# Altium project AVault.PrjPcb (part 1 of 2)
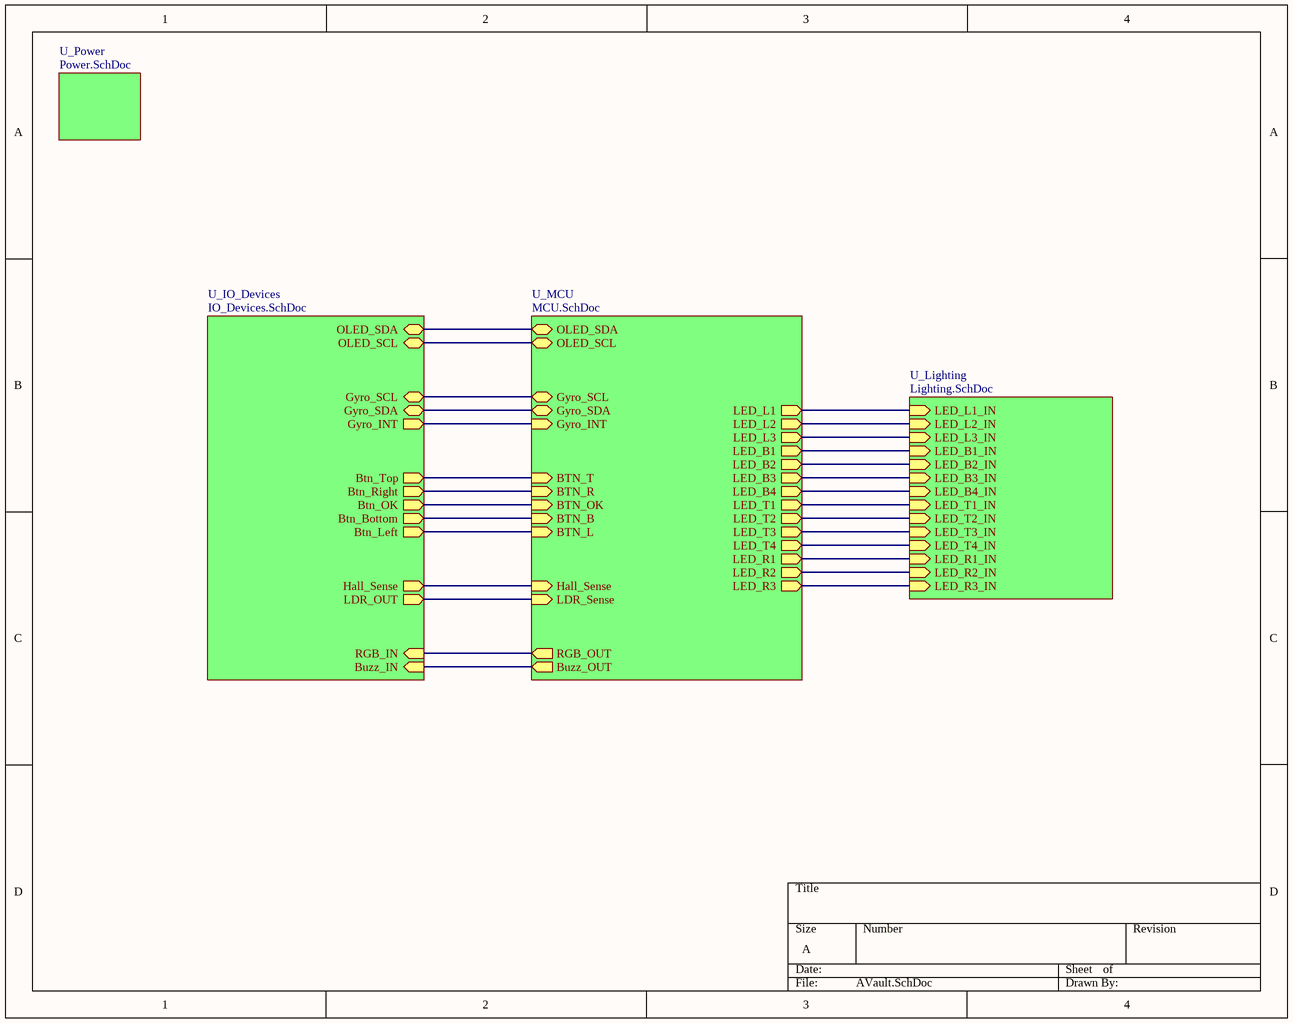
[diagram p0: AVault.SchDoc]
5 sheets, 122 parts. Net scope: hierarchical (ports join the sheet entries above them; power ports are global).
Board file: AVault.PcbDoc
Sheets:
  AVault.SchDoc
    U_Power = Power.SchDoc
    U_MCU = MCU.SchDoc
    U_IO_Devices = IO_Devices.SchDoc
    U_Lighting = Lighting.SchDoc

## Sheet AVault.SchDoc
size A; SheetNumber: 1; SheetTotal: 5

### Sub-sheets
U_IO_Devices = IO_Devices.SchDoc: OLED_SDA (bidir), OLED_SCL (bidir), Gyro_SCL (bidir), Gyro_SDA (bidir), Gyro_INT (out), Btn_Top (out), Btn_Right (out), Btn_OK (out), Btn_Bottom (out), Btn_Left (out), Hall_Sense (out), LDR_OUT (out), RGB_IN (in), Buzz_IN (in)
U_Lighting = Lighting.SchDoc: LED_L1_IN (in), LED_L2_IN (in), LED_L3_IN (in), LED_R1_IN (in), LED_R2_IN (in), LED_R3_IN (in), LED_B1_IN (in), LED_B2_IN (in), LED_B3_IN (in), LED_B4_IN (in), LED_T1_IN (in), LED_T2_IN (in), LED_T4_IN (in), LED_T3_IN (in)
U_MCU = MCU.SchDoc: OLED_SDA (bidir), OLED_SCL (bidir), Gyro_SDA (bidir), Gyro_SCL (bidir), LDR_Sense (in), LED_B3 (out), LED_B2 (out), LED_B1 (out), BTN_B (in), BTN_OK (in), BTN_T (in), BTN_R (in), BTN_L (in), LED_L3 (out), LED_L2 (out), LED_L1 (out), LED_T1 (out), LED_T2 (out), LED_T3 (out), LED_T4 (out), LED_R2 (out), LED_R3 (out), LED_R1 (out), RGB_OUT (out), Buzz_OUT (out), Hall_Sense (in), LED_B4 (out), Gyro_INT (in)
U_Power = Power.SchDoc: no entries

### Nets
NetC20_2: sheet U_MCU/BTN_L, sheet U_IO_Devices/Btn_Left
NetC21_2: sheet U_MCU/BTN_B, sheet U_IO_Devices/Btn_Bottom
NetC22_2: sheet U_MCU/BTN_OK, sheet U_IO_Devices/Btn_OK
NetC23_2: sheet U_MCU/BTN_R, sheet U_IO_Devices/Btn_Right
NetC24_2: sheet U_MCU/BTN_T, sheet U_IO_Devices/Btn_Top
NetJ3_3: sheet U_MCU/OLED_SCL, sheet U_IO_Devices/OLED_SCL
NetJ3_4: sheet U_MCU/OLED_SDA, sheet U_IO_Devices/OLED_SDA
NetR17_2: sheet U_MCU/Buzz_OUT, sheet U_IO_Devices/Buzz_IN
NetR18_1: sheet U_MCU/RGB_OUT, sheet U_IO_Devices/RGB_IN
NetR19_1: sheet U_MCU/Hall_Sense, sheet U_IO_Devices/Hall_Sense
NetR20_1: sheet U_MCU/Gyro_SCL, sheet U_IO_Devices/Gyro_SCL
NetR21_1: sheet U_MCU/Gyro_SDA, sheet U_IO_Devices/Gyro_SDA
NetR22_2: sheet U_MCU/LDR_Sense, sheet U_IO_Devices/LDR_OUT
NetU4_1: sheet U_MCU/LED_T1, sheet U_Lighting/LED_T1_IN
NetU4_15: sheet U_MCU/LED_L1, sheet U_Lighting/LED_L1_IN
NetU4_16: sheet U_MCU/LED_L2, sheet U_Lighting/LED_L2_IN
NetU4_17: sheet U_MCU/LED_L3, sheet U_Lighting/LED_L3_IN
NetU4_24: sheet U_MCU/LED_B1, sheet U_Lighting/LED_B1_IN
NetU4_30: sheet U_MCU/LED_B2, sheet U_Lighting/LED_B2_IN
NetU4_33: sheet U_MCU/LED_B3, sheet U_Lighting/LED_B3_IN
NetU4_46: sheet U_MCU/Gyro_INT, sheet U_IO_Devices/Gyro_INT
NetU4_53: sheet U_MCU/LED_B4, sheet U_Lighting/LED_B4_IN
NetU4_69: sheet U_MCU/LED_R1, sheet U_Lighting/LED_R1_IN
NetU4_70: sheet U_MCU/LED_R2, sheet U_Lighting/LED_R2_IN
NetU4_71: sheet U_MCU/LED_R3, sheet U_Lighting/LED_R3_IN
NetU4_77: sheet U_MCU/LED_T4, sheet U_Lighting/LED_T4_IN
NetU4_78: sheet U_MCU/LED_T3, sheet U_Lighting/LED_T3_IN
NetU4_98: sheet U_MCU/LED_T2, sheet U_Lighting/LED_T2_IN

## Sheet Power.SchDoc
size A; SheetNumber: 2; SheetTotal: 5
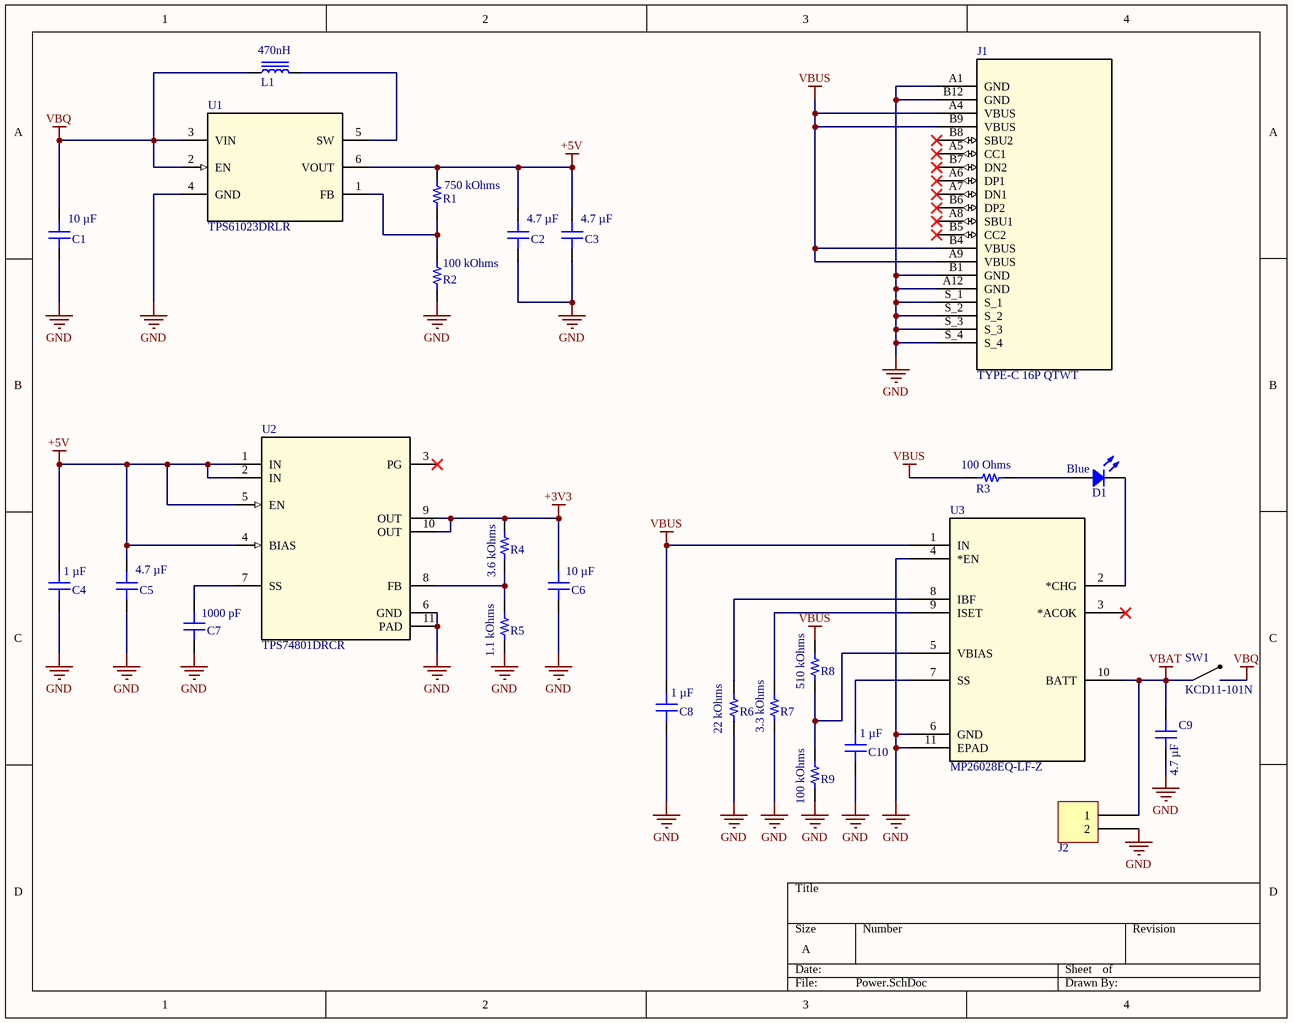
[diagram p1: Power.SchDoc]

### Parts
C1  10 µF  [CAP 0805_2012]
C2  4.7 µF  [CAP 0805_2012]
C3  4.7 µF  [CAP 0805_2012]
C4  1 µF  [CAP 0805_2012]
C5  4.7 µF  [CAP 0805_2012]
C6  10 µF  [CAP 0805_2012]
C7  1000 pF  [CAP 0603_1608]
C8  1 µF  [CAP 0805_2012]
C9  4.7 µF  [CAP 0805_2012]
C10  1 µF  [CAP 0805_2012]
D1  Blue  [LED 0805_2012 BLUE]
J1  TYPE-C 16P QTWT  [TYPE-C 16P QTWT]
J2  0022272021  [MOLEX KK 0022272021]  (value not drawn)
L1  470nH  [IND 1008_2520]
R1  750 kOhms  [RES 0805_2012]
R2  100 kOhms  [RES 0805_2012]
R3  100 Ohms  [RES 0805_2012]
R4  3.6 kOhms  [RES 0805_2012]
R5  1.1 kOhms  [RES 0805_2012]
R6  22 kOhms  [RES 0805_2012]
R7  3.3 kOhms  [RES 0805_2012]
R8  510 kOhms  [RES 0805_2012]
R9  100 kOhms  [RES 0805_2012]
SW1  KCD11-101N  [KCD11-101N]
U1  TPS61023DRLR  [DRL0006A]
U2  TPS74801DRCR  [DRC0010A]
U3  MP26028EQ-LF-Z  [IC10_MP26028_MNP]

### Nets
+3V3: C6.2 R4.2 U2.9(OUT) U2.10(OUT)
+5V: C2.2 C3.2 C4.2 C5.2 R1.1 U1.6(VOUT) U2.1(IN) U2.2(IN) U2.4(BIAS) U2.5(EN)
GND: C1.1 C2.1 C3.1 C4.1 C5.1 C6.1 C7.1 C8.1 C9.2 C10.1 J1.A1(GND) J1.A12(GND) J1.B1(GND) J1.B12(GND) J1.S_1 J1.S_2 J1.S_3 J1.S_4 J2.2 R2.1 R5.1 R6.1 R7.1 R9.1 U1.4(GND) U2.6(GND) U2.11(PAD) U3.4(*EN) U3.6(GND) U3.11(EPAD)
VBAT: C9.1 J2.1 SW1.1(CM) U3.10(BATT)
VBQ: C1.2 L1.1 SW1.2(NO) U1.2(EN) U1.3(VIN)
VBUS: C8.2 J1.A4(VBUS) J1.A9(VBUS) J1.B4(VBUS) J1.B9(VBUS) R3.2 R8.2 U3.1(IN)
NetC7_2: C7.2 U2.7(SS)
NetC10_2: C10.2 U3.7(SS)
NetD1_1: D1.1 R3.1
NetD1_2: D1.2 U3.2(*CHG)
NetL1_2: L1.2 U1.5(SW)
NetR1_2: R1.2 R2.2 U1.1(FB)
NetR4_1: R4.1 R5.2 U2.8(FB)
NetR6_2: R6.2 U3.8(IBF)
NetR7_2: R7.2 U3.9(ISET)
NetR8_1: R8.1 R9.2 U3.5(VBIAS)

Not connected (* = marked no-connect by the designer): J1 A5(CC1)* A6(DP1)* A7(DN1)* A8(SBU1)* B5(CC2)* B6(DP2)* B7(DN2)* B8(SBU2)*; U2 3(PG)*; U3 3(*ACOK)*

### Library data of the parts
C1 C6 = C2012X5R1V106K125AC: CAP CER 10UF 35V X5R 0805; Manufacturer: TDK Corporation; id: 6404; Tolerance: ±10%; Value: 10 µF; Temperature Coefficient: X5R; Part Number: C2012X5R1V106K125AC; Supplier Part Number 1: 445-14418-1-ND; ComponentLink2Description: DigiKey Link; Features: Low ESL; ComponentLink1URL: https:\\product.tdk.com\info\en\catalog\datasheets\mlcc_commercial_general_en.pdf?ref_disty=digikey; PartId: 40531; Supplier 1: DigiKey; Series: C; LastUpdated: 2023-01-03T20:10:34.680; Part Status: Active; Capacitance: 10 µF; Device Package: 0805 (2012 Metric); Thickness (Max): 0.057" (1.45mm); Voltage - Rated: 35V; Minimum Order: 1; Packaging: TapeAndReel; Applications: General Purpose; Package / Case: 0805 (2012 Metric); ComponentLink1Description: Datasheet; Price: 0.14; ComponentLink2URL: https:\\www.digikey.com\en\products\detail\tdk-corporation\C2012X5R1V106K125AC\3951654; Lifecycle Status: Active; Operating Temperature: -55°C ~ 85°C; Size / Dimension: 0.079" L x 0.049" W (2.00mm x 1.25mm); Mounting Type: Surface Mount, MLCC
C2 C3 C5 C9 = C2012X5R1H475K125AB: CAP CER 4.7UF 50V X5R 0805; Manufacturer: TDK Corporation; id: 2789; Tolerance: ±10%; Value: 4.7 µF; Temperature Coefficient: X5R; Part Number: C2012X5R1H475K125AB; Supplier Part Number 1: 445-5980-1-ND; ComponentLink2Description: DigiKey Link; Features: Low ESL; ComponentLink1URL: https:\\product.tdk.com\info\en\catalog\datasheets\mlcc_commercial_general_en.pdf?ref_disty=digikey; PartId: 15315; Supplier 1: DigiKey; Series: C; LastUpdated: 2023-01-03T20:10:23.257; Part Status: Active; Capacitance: 4.7 µF; Device Package: 0805 (2012 Metric); Thickness (Max): 0.057" (1.45mm); Voltage - Rated: 50V; Minimum Order: 1; Packaging: TapeAndReel; Applications: General Purpose; Package / Case: 0805 (2012 Metric); ComponentLink1Description: Datasheet; Price: 0.09; ComponentLink2URL: https:\\www.digikey.com\en\products\detail\tdk-corporation\C2012X5R1H475K125AB\2443458; Lifecycle Status: Active; Operating Temperature: -55°C ~ 85°C; Size / Dimension: 0.079" L x 0.049" W (2.00mm x 1.25mm); Mounting Type: Surface Mount, MLCC
C4 C8 C10 = C2012X7R1H105K125AB: CAP CER 1UF 50V X7R 0805; Manufacturer: TDK Corporation; id: 6079; Tolerance: ±10%; Part Number: C2012X7R1H105K125AB; Value: 1 µF; Temperature Coefficient: X7R; Supplier Part Number 1: 445-7547-1-ND; ComponentLink2Description: DigiKey Link; Features: Low ESL; ComponentLink1URL: https:\\product.tdk.com\info\en\catalog\datasheets\mlcc_commercial_general_en.pdf?ref_disty=digikey; PartId: 39229; Supplier 1: DigiKey; Series: C; LastUpdated: 2023-01-03T20:10:09.350; Part Status: Active; Capacitance: 1 µF; Device Package: 0805 (2012 Metric); Thickness (Max): 0.057" (1.45mm); Voltage - Rated: 50V; Minimum Order: 1; Packaging: TapeAndReel; Applications: General Purpose; Package / Case: 0805 (2012 Metric); ComponentLink1Description: Datasheet; Price: 0.05; ComponentLink2URL: https:\\www.digikey.com\en\products\detail\tdk-corporation\C2012X7R1H105K125AB\2732982; Lifecycle Status: Active; Operating Temperature: -55°C ~ 125°C; Size / Dimension: 0.079" L x 0.049" W (2.00mm x 1.25mm); Mounting Type: Surface Mount, MLCC
C7 = C1608NP02A102J080AA: CAP CER 1000PF 100V NP0 0603; Manufacturer: TDK Corporation; id: 4166; Temperature Coefficient: C0G, NP0; Tolerance: ±5%; Part Number: C1608NP02A102J080AA; Value: 1000 pF; Supplier Part Number 1: 445-14106-1-ND; ComponentLink2Description: DigiKey Link; Features: High Temperature; ComponentLink1URL: https:\\product.tdk.com\info\en\catalog\datasheets\mlcc_commercial_hightemp_en.pdf?ref_disty=digikey; PartId: 17647; Supplier 1: DigiKey; Series: C; LastUpdated: 2023-01-03T20:07:00.130; Part Status: Active; Capacitance: 1000 pF; Device Package: 0603 (1608 Metric); Thickness (Max): 0.035" (0.90mm); Voltage - Rated: 100V; Minimum Order: 1; Packaging: TapeAndReel; Applications: General Purpose; Package / Case: 0603 (1608 Metric); ComponentLink1Description: Datasheet; Price: 0.03; ComponentLink2URL: https:\\www.digikey.com\en\products\detail\tdk-corporation\C1608NP02A102J080AA\3951342; Lifecycle Status: Active; Operating Temperature: -55°C ~ 150°C; Size / Dimension: 0.063" L x 0.031" W (1.60mm x 0.80mm); Mounting Type: Surface Mount, MLCC
D1 = 5975606507F: LED BLUE 0805 SMD; Manufacturer: Dialight; id: 753; Lens Color: 0.93mm; Lens Style: Rectangle with Flat Top; Lens Size: 1.40mm x 1.24mm; Configuration: Standard; Wavelength - Dominant: 470nm; Voltage - Forward (Vf) (Typ): 2.9V; Current - Test: 5mA; Millicandela Rating: 36mcd; Part Number: 5975606507F; Supplier Part Number 1: 350-4390-1-ND; Supplier Device Package: 0805; ComponentLink1Description: Datasheet; Color: Blue; ComponentLink2URL: https:\\www.digikey.com\en\products\detail\dialight\5975606507F\9385445; ComponentLink1URL: http:\\www.dialightsignalsandcomponents.com\Assets\Drawings\2D_Drawings_DrawingDetailedSpec\NewDrawings\18370A.pdf; Supplier 1: DigiKey; Series: 597; Height (Max): 0.93mm; Part Status: Active; ComponentLink2Description: DigiKey Link; Device Package: 0805 (2012 Metric); Packaging: TapeAndReel; Minimum Order: 1; Package / Case: 0805 (2012 Metric); PartId: 753; Lifecycle Status: Active; LastUpdated: 2023-01-02T20:56:19; Value: Blue; Size / Dimension: 2.00mm L x 1.25mm W; Mounting Type: Surface Mount; Price: 0.14
J1 = TYPE-C 16P QTWT: USB Type-C Female Connector USB 3, Right Angle, 16P 3A 1 Ports; Manufacturer_Name: SHOUHAN; Manufacturer_Part_Number: TYPE-C 16P QTWT
J2 = 0022272021: CONN HEADER VERT 2POS 2.54MM; Manufacturer: Molex; id: 76; Style: Board to Cable\Wire; Contact Length - Mating: 0.295" (7.49mm); Pitch - Mating: 0.100" (2.54mm); Number Of Positions: 2; Number Of Positions Loaded: All; Shrouding: Shrouded - 1 Wall; Material Flammability Rating: UL94 V-0; Overall Contact Length: 0.560" (14.22mm); Contact Length - Post: 0.140" (3.56mm); Part Number: 0022272021; Supplier Part Number 1: WM4111-ND; Contact Shape: Square; Termination: Solder; ComponentLink1Description: Datasheet; Connector Type: Header; Contact Material: Brass; ComponentLink2URL: http:\\digikey.com\product-detail\en\molex\0022272021\WM4111-ND\1130577; Contact Finish - Mating: Tin; ComponentLink1URL: https:\\www.molex.com\pdm_docs\sd\022272021_sd.pdf; Fastening Type: Friction Lock; Supplier 1: DigiKey; Number Of Rows: 1; Series: KK 6410; Part Status: Active; ComponentLink2Description: DigiKey Link; Contact Type: Male Pin; Packaging: Bulk; Insulation Height: 0.461" (11.70mm); Contact Finish - Post: Tin; Contact Finish Thickness - Mating: 100.0µin (2.54µm); Minimum Order: 1; PartId: 76; Lifecycle Status: Active; LastUpdated: 2020-01-12T23:51:43.453; Insulation Color: Natural; Mounting Type: Through Hole; Insulation Material: Polyamide (PA), Nylon; Price: 0.27
L1 = DFE252010P-R47M=P2: FIXED IND 470NH 5A 35 MOHM SMD; Part Number: DFE252012F-R47M=P2; Manufacturer: Murata Electronics; id: 3453; Tolerance: ±20%; Type: Wirewound; Inductance Frequency - Test: 1MHz; Material - Core: Iron Powder; DC Resistance (DCR): 35mOhm Max; Shielding: Shielded; Height - Seated (Max): 0.039" (1.00mm); Supplier Part Number 1: 490-10641-1-ND; Current Rating (Amps): 5A; Supplier Device Package: 1008 (2520 Metric); Inductance: 470nH; ComponentLink1Description: Datasheet; ComponentLink2URL: http:\\digikey.com\product-detail\en\murata-electronics\DFE252010P-R47M=P2\490-10641-1-ND\5272069; ComponentLink1URL: https:\\www.murata.com\~\media\webrenewal\products\inductor\chip\tokoproducts\wirewoundmetalalloychiptype\m_dfe252010p.ashx; Supplier 1: DigiKey; Series: DFE252010P; Part Status: Active; ComponentLink2Description: DigiKey Link; Device Package: 1008 (2520 Metric); Packaging: TapeAndReel; Minimum Order: 1; Package / Case: 1008 (2520 Metric); PartId: 3481; Lifecycle Status: Active; LastUpdated: 2022-03-24T14:40:41.850; Operating Temperature: -40°C ~ 125°C; Value: 470nH; Size / Dimension: 0.098" L x 0.079" W (2.50mm x 2.00mm); Mounting Type: Surface Mount; Price: 0.16
R1 = RMCF0805FT750K: RES 750K OHM 1% 1\8W 0805; Manufacturer: Stackpole Electronics Inc; id: 88; Temperature Coefficient: ±100ppm\°C; Power (Watts): 0.125W, 1\8W; Height - Seated (Max): 0.026" (0.65mm); Part Number: RMCF0805FT750K; Supplier Part Number 1: RMCF0805FT750KCT-ND; Supplier Device Package: 0805; ComponentLink1Description: Datasheet; ComponentLink2URL: https:\\www.digikey.com\en\products\detail\stackpole-electronics-inc\RMCF0805FT750K\1760532; Features: Automotive AEC-Q200; ComponentLink1URL: https:\\www.seielect.com\catalog\sei-rmcf_rmcp.pdf; Composition: Thick Film; Tolerance: ±1%; Supplier 1: DigiKey; Series: RMCF; Part Status: Active; ComponentLink2Description: DigiKey Link; Device Package: 0805 (2012 Metric); Packaging: CutTape; Ratings: AEC-Q200; Minimum Order: 1; Package / Case: 0805 (2012 Metric); PartId: 27859; Lifecycle Status: Active; LastUpdated: 2023-01-02T20:44:51.690; Operating Temperature: -55°C ~ 155°C; Number Of Terminations: 2; Value: 750 kOhms; Size / Dimension: 0.079" L x 0.049" W (2.00mm x 1.25mm); Price: 0.01; Resistance: 750 kOhms
R2 R9 = CRGP0805F100K: RES 100K OHM 1% 1\3W 0805; Manufacturer: TE Connectivity Passive Product; id: 527; Temperature Coefficient: ±100ppm\°C; Power (Watts): 0.333W, 1\3W; Height - Seated (Max): 0.026" (0.65mm); Part Number: CRGP0805F100K; Supplier Part Number 1: A130501CT-ND; Supplier Device Package: 0805; ComponentLink1Description: Datasheet; ComponentLink2URL: https:\\www.digikey.com\en\products\detail\te-connectivity-passive-product\CRGP0805F100K\8577103; Features: Pulse Withstanding; ComponentLink1URL: https:\\www.te.com\commerce\DocumentDelivery\DDEController?Action=srchrtrv&DocNm=9-1773463-9&DocType=DS&DocLang=English; Composition: Thick Film; Tolerance: ±1%; Supplier 1: DigiKey; Series: CRGP; Part Status: Active; ComponentLink2Description: DigiKey Link; Device Package: 0805 (2012 Metric); Packaging: TapeAndReel; Minimum Order: 1; Package / Case: 0805 (2012 Metric); PartId: 28747; Lifecycle Status: Active; LastUpdated: 2023-01-02T20:44:47.767; Operating Temperature: -55°C ~ 155°C; Number Of Terminations: 2; Value: 100 kOhms; Size / Dimension: 0.079" L x 0.049" W (2.00mm x 1.25mm); Price: 0.02; Resistance: 100 kOhms
R3 = RNCS0805BKE100R: RES 100 OHM 0.1% 1\10W 0805; Manufacturer: Stackpole Electronics Inc; id: 1341; Temperature Coefficient: ±25ppm\°C; Power (Watts): 0.1W, 1\10W; Part Number: RNCS0805BKE100R; Height - Seated (Max): 0.026" (0.65mm); Supplier Part Number 1: RNCS0805BKE100RCT-ND; Supplier Device Package: 0805; ComponentLink1Description: Datasheet; ComponentLink2URL: https:\\www.digikey.com\en\products\detail\stackpole-electronics-inc\RNCS0805BKE100R\1800065; Features: Anti-Corrosive, Automotive AEC-Q200, Moisture Resistant; ComponentLink1URL: https:\\www.seielect.com\catalog\sei-rncs_rnch.pdf; Composition: Thin Film; Tolerance: ±0.1%; Supplier 1: DigiKey; Series: RNCS; Part Status: Active; ComponentLink2Description: DigiKey Link; Device Package: 0805 (2012 Metric); Packaging: TapeAndReel; Ratings: AEC-Q200; Minimum Order: 1; Package / Case: 0805 (2012 Metric); PartId: 30410; Lifecycle Status: Active; LastUpdated: 2023-01-02T20:44:41.260; Operating Temperature: -55°C ~ 155°C; Number Of Terminations: 2; Value: 100 Ohms; Size / Dimension: 0.079" L x 0.049" W (2.00mm x 1.25mm); Price: 0.09; Resistance: 100 Ohms
R4 = RMCF0805FT3K60: RES 3.6K OHM 1% 1\8W 0805; Manufacturer: Stackpole Electronics Inc; id: 2405; Temperature Coefficient: ±100ppm\°C; Power (Watts): 0.125W, 1\8W; Part Number: RMCF0805FT3K60; Height - Seated (Max): 0.026" (0.65mm); Supplier Part Number 1: RMCF0805FT3K60CT-ND; Supplier Device Package: 0805; ComponentLink1Description: Datasheet; ComponentLink2URL: https:\\www.digikey.com\en\products\detail\stackpole-electronics-inc\RMCF0805FT3K60\1712987; Features: Automotive AEC-Q200; ComponentLink1URL: https:\\www.seielect.com\catalog\sei-rmcf_rmcp.pdf; Composition: Thick Film; Tolerance: ±1%; Supplier 1: DigiKey; Series: RMCF; Part Status: Active; ComponentLink2Description: DigiKey Link; Device Package: 0805 (2012 Metric); Packaging: CutTape; Ratings: AEC-Q200; Minimum Order: 1; Package / Case: 0805 (2012 Metric); PartId: 32503; Lifecycle Status: Active; LastUpdated: 2023-01-02T20:44:32.503; Operating Temperature: -55°C ~ 155°C; Number Of Terminations: 2; Value: 3.6 kOhms; Size / Dimension: 0.079" L x 0.049" W (2.00mm x 1.25mm); Price: 0.01; Resistance: 3.6 kOhms
R5 = RMCF0805FG1K10: RES 1.1K OHM 1% 1\8W 0805; Manufacturer: Stackpole Electronics Inc; id: 606; Temperature Coefficient: ±100ppm\°C; Power (Watts): 0.125W, 1\8W; Part Number: RMCF0805FG1K10; Height - Seated (Max): 0.026" (0.65mm); Supplier Part Number 1: RMCF0805FG1K10CT-ND; Supplier Device Package: 0805; ComponentLink1Description: Datasheet; ComponentLink2URL: https:\\www.digikey.com\en\products\detail\stackpole-electronics-inc\RMCF0805FG1K10\1760461; Features: Automotive AEC-Q200; ComponentLink1URL: https:\\www.seielect.com\catalog\sei-rmcf_rmcp.pdf; Composition: Thick Film; Tolerance: ±1%; Supplier 1: DigiKey; Series: RMCF; Part Status: Active; ComponentLink2Description: DigiKey Link; Device Package: 0805 (2012 Metric); Packaging: CutTape; Ratings: AEC-Q200; Minimum Order: 1; Package / Case: 0805 (2012 Metric); PartId: 28907; Lifecycle Status: Active; LastUpdated: 2023-01-02T20:44:47.117; Operating Temperature: -55°C ~ 155°C; Number Of Terminations: 2; Value: 1.1 kOhms; Size / Dimension: 0.079" L x 0.049" W (2.00mm x 1.25mm); Price: 0.01; Resistance: 1.1 kOhms
R6 = RMCF0805FT22K0: RES 22K OHM 1% 1\8W 0805; Manufacturer: Stackpole Electronics Inc; id: 2357; Temperature Coefficient: ±100ppm\°C; Power (Watts): 0.125W, 1\8W; Part Number: RMCF0805FT22K0; Height - Seated (Max): 0.026" (0.65mm); Supplier Part Number 1: RMCF0805FT22K0CT-ND; Supplier Device Package: 0805; ComponentLink1Description: Datasheet; ComponentLink2URL: https:\\www.digikey.com\en\products\detail\stackpole-electronics-inc\RMCF0805FT22K0\1760246; Features: Automotive AEC-Q200; ComponentLink1URL: https:\\www.seielect.com\catalog\sei-rmcf_rmcp.pdf; Composition: Thick Film; Tolerance: ±1%; Supplier 1: DigiKey; Series: RMCF; Part Status: Active; ComponentLink2Description: DigiKey Link; Device Package: 0805 (2012 Metric); Packaging: CutTape; Ratings: AEC-Q200; Minimum Order: 1; Package / Case: 0805 (2012 Metric); PartId: 32406; Lifecycle Status: Active; LastUpdated: 2023-01-02T20:44:32.837; Operating Temperature: -55°C ~ 155°C; Number Of Terminations: 2; Value: 22 kOhms; Size / Dimension: 0.079" L x 0.049" W (2.00mm x 1.25mm); Price: 0.01; Resistance: 22 kOhms
R7 = RMCF0805FT3K30: RES 3.3K OHM 1% 1\8W 0805; Manufacturer: Stackpole Electronics Inc; id: 2398; Temperature Coefficient: ±100ppm\°C; Power (Watts): 0.125W, 1\8W; Part Number: RMCF0805FT3K30; Height - Seated (Max): 0.026" (0.65mm); Supplier Part Number 1: RMCF0805FT3K30CT-ND; Supplier Device Package: 0805; ComponentLink1Description: Datasheet; ComponentLink2URL: https:\\www.digikey.com\en\products\detail\stackpole-electronics-inc\RMCF0805FT3K30\1760325; Features: Automotive AEC-Q200; ComponentLink1URL: https:\\www.seielect.com\catalog\sei-rmcf_rmcp.pdf; Composition: Thick Film; Tolerance: ±1%; Supplier 1: DigiKey; Series: RMCF; Part Status: Active; ComponentLink2Description: DigiKey Link; Device Package: 0805 (2012 Metric); Packaging: CutTape; Ratings: AEC-Q200; Minimum Order: 1; Package / Case: 0805 (2012 Metric); PartId: 32489; Lifecycle Status: Active; LastUpdated: 2023-01-02T20:44:32.553; Operating Temperature: -55°C ~ 155°C; Number Of Terminations: 2; Value: 3.3 kOhms; Size / Dimension: 0.079" L x 0.049" W (2.00mm x 1.25mm); Price: 0.01; Resistance: 3.3 kOhms
R8 = RMCF0805FT510K: RES 510K OHM 1% 1\8W 0805; Manufacturer: Stackpole Electronics Inc; id: 909; Temperature Coefficient: ±100ppm\°C; Power (Watts): 0.125W, 1\8W; Part Number: RMCF0805FT510K; Height - Seated (Max): 0.026" (0.65mm); Supplier Part Number 1: RMCF0805FT510KCT-ND; Supplier Device Package: 0805; ComponentLink1Description: Datasheet; ComponentLink2URL: https:\\www.digikey.com\en\products\detail\stackpole-electronics-inc\RMCF0805FT510K\1713215; Features: Automotive AEC-Q200; ComponentLink1URL: https:\\www.seielect.com\catalog\sei-rmcf_rmcp.pdf; Composition: Thick Film; Tolerance: ±1%; Supplier 1: DigiKey; Series: RMCF; Part Status: Active; ComponentLink2Description: DigiKey Link; Device Package: 0805 (2012 Metric); Packaging: CutTape; Ratings: AEC-Q200; Minimum Order: 1; Package / Case: 0805 (2012 Metric); PartId: 29516; Lifecycle Status: Active; LastUpdated: 2023-01-02T20:44:44.913; Operating Temperature: -55°C ~ 155°C; Number Of Terminations: 2; Value: 510 kOhms; Size / Dimension: 0.079" L x 0.049" W (2.00mm x 1.25mm); Price: 0.01; Resistance: 510 kOhms
SW1 = KCD11-101N: Rocker Switch SPST; Manufacturer Name: Non-Brand; Manufacturer Part Number: KCD1-2-(3A 250V AC)
U1 = TPS61023DRLR: Boost Switching Regulator IC Positive Adjustable 2.2V 1 Output 3A SOT-563, SOT-666; Manufacturer Name: Texas Instruments; Manufacturer Part Number: TPS61023DRLR
U2 = TPS74801DRCR: Linear Voltage Regulator IC Positive Adjustable 1 Output 1.5A 10-VSON (3x3); Manufacturer Name: Texas Instruments; Manufacturer Part Number: TPS74801DRCR; Application_BuildNumber: *; PackageReference: DRC0010A; MountType: SMT; CompType: IC; RoHS: Y; Manufacturer: Texas Instruments
U3 = MP26028EQ-LF-Z: 1A Linear Li-Ion Battery Charger with Trickle Charge; Manufacturer Name: Monolithic Power Systems; Manufacturer Part Number: MP26028EQ-LF-Z

## Sheet MCU.SchDoc
size B; SheetNumber: 3; SheetTotal: 5
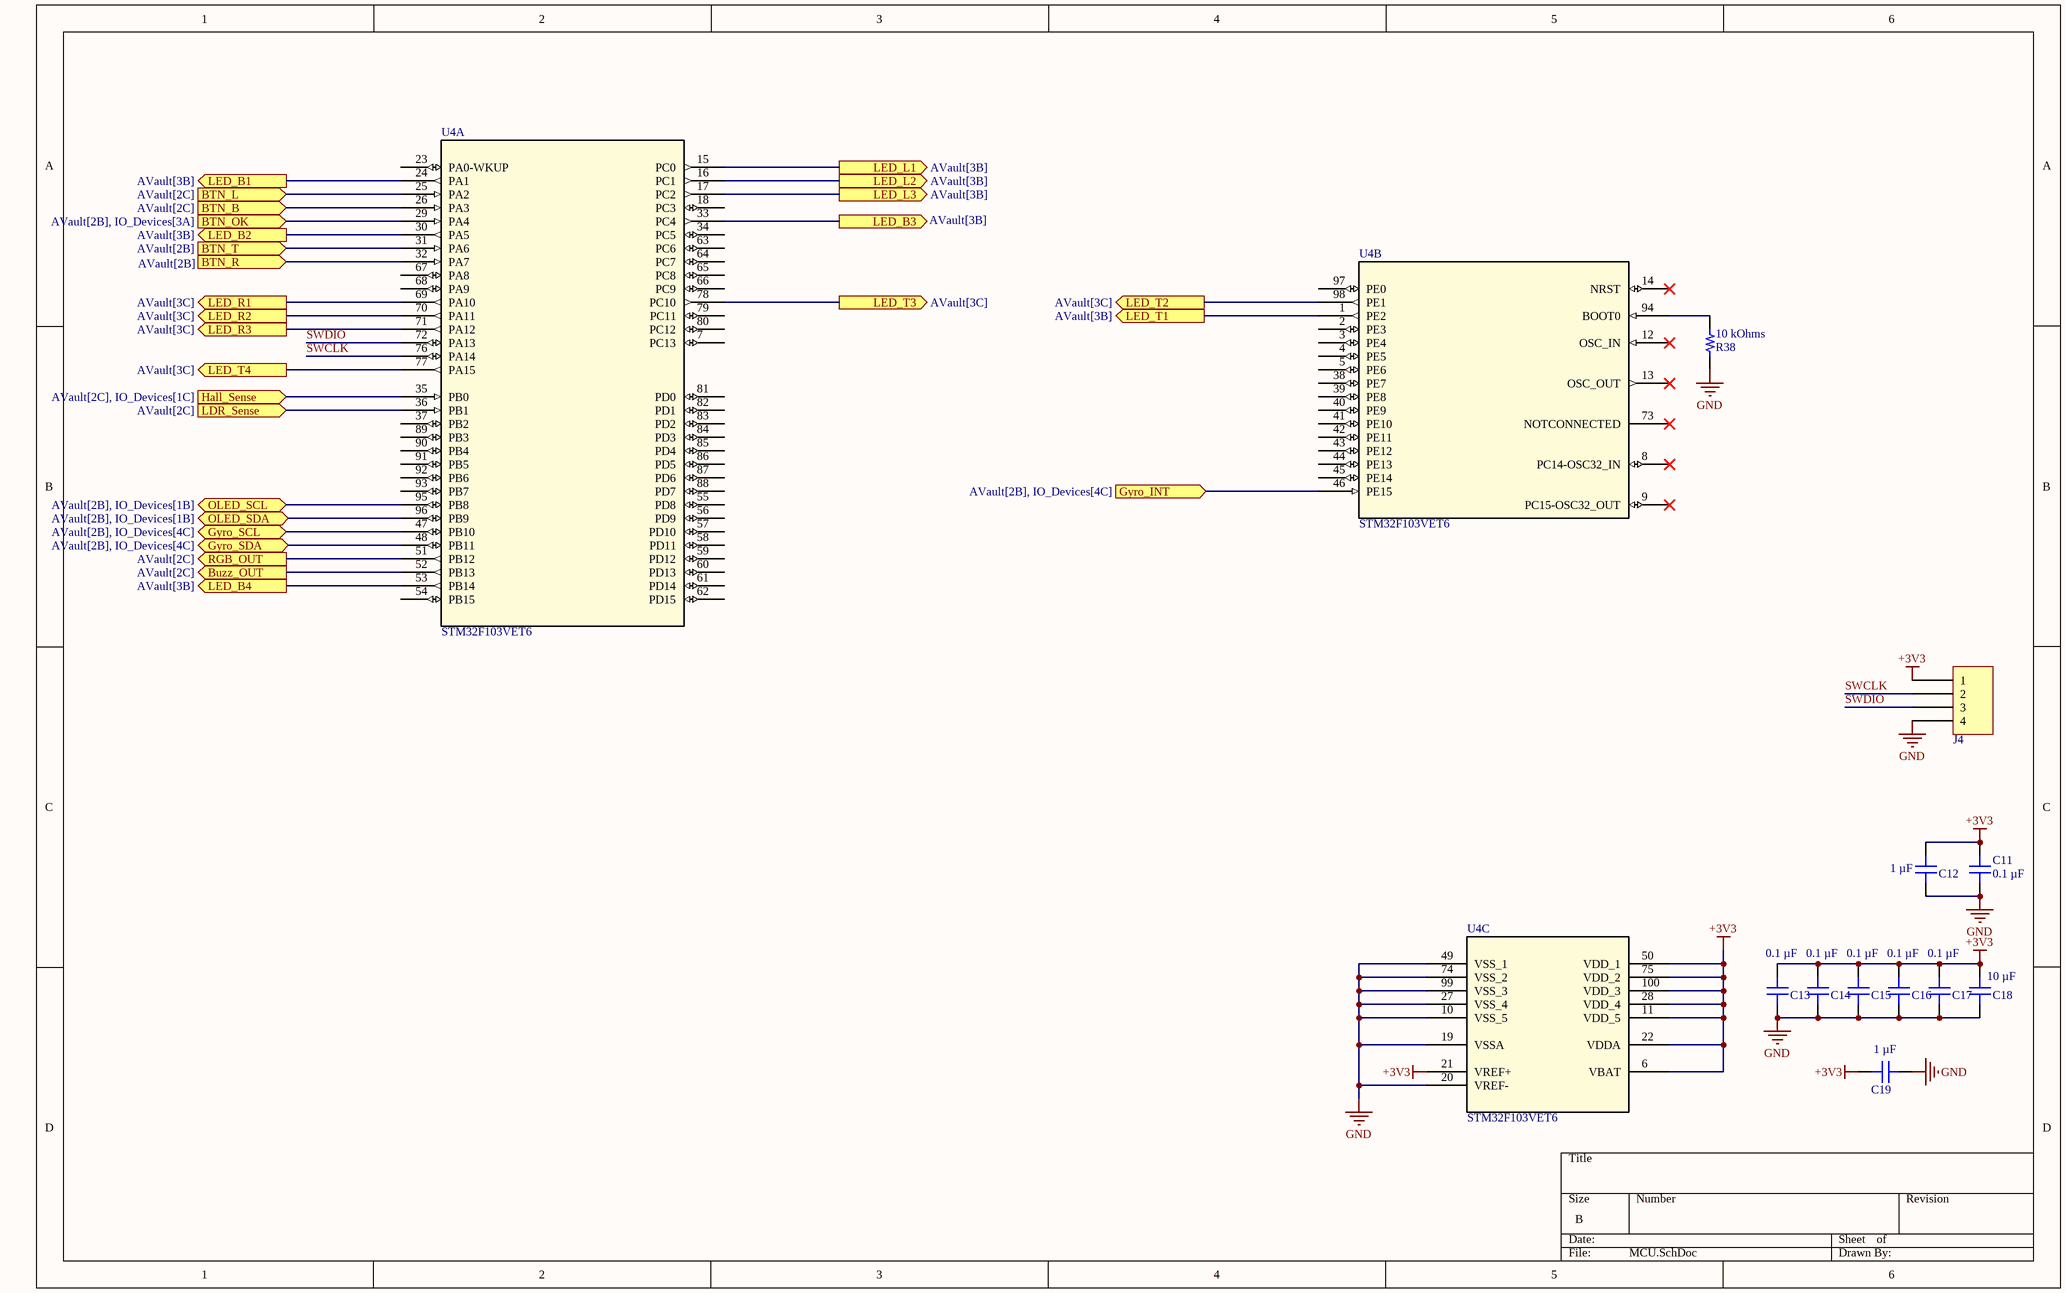
[diagram p2: MCU.SchDoc]

### Parts
C11  0.1 µF  [CAP 0603_1608]
C12  1 µF  [CAP 0603_1608]
C13  0.1 µF  [CAP 0603_1608]
C14  0.1 µF  [CAP 0603_1608]
C15  0.1 µF  [CAP 0603_1608]
C16  0.1 µF  [CAP 0603_1608]
C17  0.1 µF  [CAP 0603_1608]
C18  10 µF  [CAP 0805_2012]
C19  1 µF  [CAP 0603_1608]
J4  0022272041  [MOLEX KK 0022272041]  (value not drawn)
R38  10 kOhms  [RES 0805_2012]
U4  STM32F103VET6  [LQFP100-14x14mm]  (parts A,B,C of 3)

### Ports
BTN_B (in, see AVault[2C]), BTN_L (in, see AVault[2C]), BTN_OK (in, see AVault[2B], IO_Devices[3A]), BTN_R (in, see AVault[2B]), BTN_T (in, see AVault[2B]), Buzz_OUT (out, see AVault[2C]), Gyro_INT (in, see AVault[2B], IO_Devices[4C]), Gyro_SCL (bidir, see AVault[2B], IO_Devices[4C]), Gyro_SDA (bidir, see AVault[2B], IO_Devices[4C]), Hall_Sense (in, see AVault[2C], IO_Devices[1C]), LDR_Sense (in, see AVault[2C]), LED_B1 (out, see AVault[3B]), LED_B2 (out, see AVault[3B]), LED_B3 (out, see AVault[3B]), LED_B4 (out, see AVault[3B]), LED_L1 (out, see AVault[3B]), LED_L2 (out, see AVault[3B]), LED_L3 (out, see AVault[3B]), LED_R1 (out, see AVault[3C]), LED_R2 (out, see AVault[3C]), LED_R3 (out, see AVault[3C]), LED_T1 (out, see AVault[3B]), LED_T2 (out, see AVault[3C]), LED_T3 (out, see AVault[3C]), LED_T4 (out, see AVault[3C]), OLED_SCL (bidir, see AVault[2B], IO_Devices[1B]), OLED_SDA (bidir, see AVault[2B], IO_Devices[1B]), RGB_OUT (out, see AVault[2C])

### Nets
+3V3: C11.2 C12.2 C13.2 C14.2 C15.2 C16.2 C17.2 C18.2 C19.2 J4.1 U4.6(VBAT) U4.11(VDD_5) U4.21(VREF+) U4.22(VDDA) U4.28(VDD_4) U4.50(VDD_1) U4.75(VDD_2) U4.100(VDD_3)
GND: C11.1 C12.1 C13.1 C14.1 C15.1 C16.1 C17.1 C18.1 C19.1 J4.4 R38.1 U4.10(VSS_5) U4.19(VSSA) U4.20(VREF-) U4.27(VSS_4) U4.49(VSS_1) U4.74(VSS_2) U4.99(VSS_3)
SWCLK: J4.2 U4.76(PA14)
SWDIO: J4.3 U4.72(PA13)
NetC20_2: U4.25(PA2) ; port BTN_L
NetC21_2: U4.26(PA3) ; port BTN_B
NetC22_2: U4.29(PA4) ; port BTN_OK
NetC23_2: U4.32(PA7) ; port BTN_R
NetC24_2: U4.31(PA6) ; port BTN_T
NetJ3_3: U4.95(PB8) ; port OLED_SCL
NetJ3_4: U4.96(PB9) ; port OLED_SDA
NetR17_2: U4.52(PB13) ; port Buzz_OUT
NetR18_1: U4.51(PB12) ; port RGB_OUT
NetR19_1: U4.35(PB0) ; port Hall_Sense
NetR20_1: U4.47(PB10) ; port Gyro_SCL
NetR21_1: U4.48(PB11) ; port Gyro_SDA
NetR22_2: U4.36(PB1) ; port LDR_Sense
NetR38_2: R38.2 U4.94(BOOT0)
NetU4_1: U4.1(PE2) ; port LED_T1
NetU4_15: U4.15(PC0) ; port LED_L1
NetU4_16: U4.16(PC1) ; port LED_L2
NetU4_17: U4.17(PC2) ; port LED_L3
NetU4_24: U4.24(PA1) ; port LED_B1
NetU4_30: U4.30(PA5) ; port LED_B2
NetU4_33: U4.33(PC4) ; port LED_B3
NetU4_46: U4.46(PE15) ; port Gyro_INT
NetU4_53: U4.53(PB14) ; port LED_B4
NetU4_69: U4.69(PA10) ; port LED_R1
NetU4_70: U4.70(PA11) ; port LED_R2
NetU4_71: U4.71(PA12) ; port LED_R3
NetU4_77: U4.77(PA15) ; port LED_T4
NetU4_78: U4.78(PC10) ; port LED_T3
NetU4_98: U4.98(PE1) ; port LED_T2

Not connected (* = marked no-connect by the designer): U4 2(PE3) 3(PE4) 4(PE5) 5(PE6) 7(PC13) 8(PC14-OSC32_IN)* 9(PC15-OSC32_OUT)* 12(OSC_IN)* 13(OSC_OUT)* 14(NRST)* 18(PC3) 23(PA0-WKUP) 34(PC5) 37(PB2) 38(PE7) 39(PE8) 40(PE9) 41(PE10) 42(PE11) 43(PE12) 44(PE13) 45(PE14) 54(PB15) 55(PD8) 56(PD9) 57(PD10) 58(PD11) 59(PD12) 60(PD13) 61(PD14) 62(PD15) 63(PC6) 64(PC7) 65(PC8) 66(PC9) 67(PA8) 68(PA9) 73(NOTCONNECTED)* 79(PC11) 80(PC12) 81(PD0) 82(PD1) 83(PD2) 84(PD3) 85(PD4) 86(PD5) 87(PD6) 88(PD7) 89(PB3) 90(PB4) 91(PB5) 92(PB6) 93(PB7) 97(PE0)

### Library data of the parts
C11 C13-C17 = GRM188R72A104KA35D: CAP CER 0.1UF 100V X7R 0603; Manufacturer: Murata Electronics; id: 1738; Tolerance: ±10%; Part Number: GRM188R72A104KA35D; Value: 0.1 µF; Temperature Coefficient: X7R; Supplier Part Number 1: 490-3285-1-ND; ComponentLink2Description: DigiKey Link; ComponentLink1URL: https:\\www.murata.com\~\media\webrenewal\support\library\catalog\products\capacitor\mlcc\c02e.ashx?la=en-us; PartId: 9563; Supplier 1: DigiKey; Series: GRM; LastUpdated: 2023-01-03T20:07:27.117; Part Status: Active; Capacitance: 0.1 µF; Device Package: 0603 (1608 Metric); Thickness (Max): 0.035" (0.90mm); Voltage - Rated: 100V; Minimum Order: 1; Packaging: TapeAndReel; Applications: General Purpose; Package / Case: 0603 (1608 Metric); ComponentLink1Description: Datasheet; Price: 0.02; ComponentLink2URL: https:\\www.digikey.com\en\products\detail\murata-electronics\GRM188R72A104KA35D\702549; Lifecycle Status: Active; Operating Temperature: -55°C ~ 125°C; Size / Dimension: 0.063" L x 0.031" W (1.60mm x 0.80mm); Mounting Type: Surface Mount, MLCC
C12 C19 = C1608X5R1E105K080AC: CAP CER 1UF 25V X5R 0603; Manufacturer: TDK Corporation; id: 6225; Tolerance: ±10%; Part Number: C1608X5R1E105K080AC; Value: 1 µF; Temperature Coefficient: X5R; Supplier Part Number 1: 445-5146-1-ND; ComponentLink2Description: DigiKey Link; Features: Low ESL; ComponentLink1URL: https:\\product.tdk.com\info\en\catalog\datasheets\mlcc_commercial_general_en.pdf?ref_disty=digikey; PartId: 36204; Supplier 1: DigiKey; Series: C; LastUpdated: 2023-01-03T20:06:52.917; Part Status: Active; Capacitance: 1 µF; Device Package: 0603 (1608 Metric); Thickness (Max): 0.035" (0.90mm); Voltage - Rated: 25V; Minimum Order: 1; Packaging: TapeAndReel; Applications: General Purpose; Package / Case: 0603 (1608 Metric); ComponentLink1Description: Datasheet; Price: 0.01; ComponentLink2URL: https:\\www.digikey.com\en\products\detail\tdk-corporation\C1608X5R1E105K080AC\2093414; Lifecycle Status: Active; Operating Temperature: -55°C ~ 85°C; Size / Dimension: 0.063" L x 0.031" W (1.60mm x 0.80mm); Mounting Type: Surface Mount, MLCC
C18 = C2012X5R1V106K125AC: as C1 on sheet Power; Value: 10 µF; Temperature Coefficient: X5R; Part Number: C2012X5R1V106K125AC; Supplier Part Number 1: 445-14418-1-ND; ComponentLink2Description: DigiKey Link; Features: Low ESL; ComponentLink1URL: https:\\product.tdk.com\info\en\catalog\datasheets\mlcc_commercial_general_en.pdf?ref_disty=digikey; PartId: 40531; Supplier 1: DigiKey; Series: C; LastUpdated: 2023-01-03T20:10:34.680; Part Status: Active; Capacitance: 10 µF; Device Package: 0805 (2012 Metric); Thickness (Max): 0.057" (1.45mm); Voltage - Rated: 35V; Minimum Order: 1; Packaging: TapeAndReel; Applications: General Purpose; Package / Case: 0805 (2012 Metric); ComponentLink1Description: Datasheet; Price: 0.14; ComponentLink2URL: https:\\www.digikey.com\en\products\detail\tdk-corporation\C2012X5R1V106K125AC\3951654; Lifecycle Status: Active; Operating Temperature: -55°C ~ 85°C; Size / Dimension: 0.079" L x 0.049" W (2.00mm x 1.25mm); Mounting Type: Surface Mount, MLCC
J4 = 0022272041: CONN HEADER VERT 4POS 2.54MM; Manufacturer: Molex; id: 78; Style: Board to Cable\Wire; Contact Length - Mating: 0.295" (7.49mm); Pitch - Mating: 0.100" (2.54mm); Number Of Positions: 4; Number Of Positions Loaded: All; Shrouding: Shrouded - 1 Wall; Material Flammability Rating: UL94 V-0; Overall Contact Length: 0.560" (14.22mm); Contact Length - Post: 0.140" (3.56mm); Part Number: 0022272041; Supplier Part Number 1: WM4113-ND; Contact Shape: Square; Termination: Solder; ComponentLink1Description: Datasheet; Connector Type: Header; Contact Material: Brass; ComponentLink2URL: http:\\digikey.com\product-detail\en\molex\0022272041\WM4113-ND\1130579; Contact Finish - Mating: Tin; ComponentLink1URL: https:\\www.molex.com\pdm_docs\sd\022272041_sd.pdf; Fastening Type: Friction Lock; Supplier 1: DigiKey; Number Of Rows: 1; Series: KK 6410; Part Status: Active; ComponentLink2Description: DigiKey Link; Contact Type: Male Pin; Packaging: Bulk; Insulation Height: 0.461" (11.70mm); Contact Finish - Post: Tin; Contact Finish Thickness - Mating: 100.0µin (2.54µm); Minimum Order: 1; PartId: 78; Lifecycle Status: Active; LastUpdated: 2020-01-12T23:52:05.287; Insulation Color: Natural; Mounting Type: Through Hole; Insulation Material: Polyamide (PA), Nylon; Price: 0.40
R38 = RNCP0805FTD10K0: RES 10K OHM 1% 1\4W 0805; Manufacturer: Stackpole Electronics Inc; id: 164; Temperature Coefficient: ±100ppm\°C; Power (Watts): 0.25W, 1\4W; Part Number: RNCP0805FTD10K0; Height - Seated (Max): 0.025" (0.65mm); Supplier Part Number 1: RNCP0805FTD10K0CT-ND; Supplier Device Package: 0805; ComponentLink1Description: Datasheet; ComponentLink2URL: https:\\www.digikey.com\en\products\detail\stackpole-electronics-inc\RNCP0805FTD10K0\2240262; Features: Anti-Sulfur; ComponentLink1URL: https:\\www.seielect.com\catalog\sei-rncp.pdf; Composition: Thin Film; Tolerance: ±1%; Supplier 1: DigiKey; Series: RNCP; Part Status: Active; ComponentLink2Description: DigiKey Link; Device Package: 0805 (2012 Metric); Packaging: TapeAndReel; Minimum Order: 1; Package / Case: 0805 (2012 Metric); PartId: 28021; Lifecycle Status: Active; LastUpdated: 2023-01-02T20:44:50.960; Operating Temperature: -55°C ~ 155°C; Number Of Terminations: 2; Value: 10 kOhms; Size / Dimension: 0.079" L x 0.049" W (2.00mm x 1.25mm); Price: 0.01; Resistance: 10 kOhms
U4 = STM32F103VET6: Mainstream Performance line, Arm Cortex-M3 MCU with 512 Kbytes of Flash memory, 72 MHz CPU, motor control, USB and CAN; Manufacturer Name: STMicroelectronics; Manufacturer Part Number: STM32F103VET6

## Sheet IO_Devices.SchDoc
size A; SheetNumber: 4; SheetTotal: 5
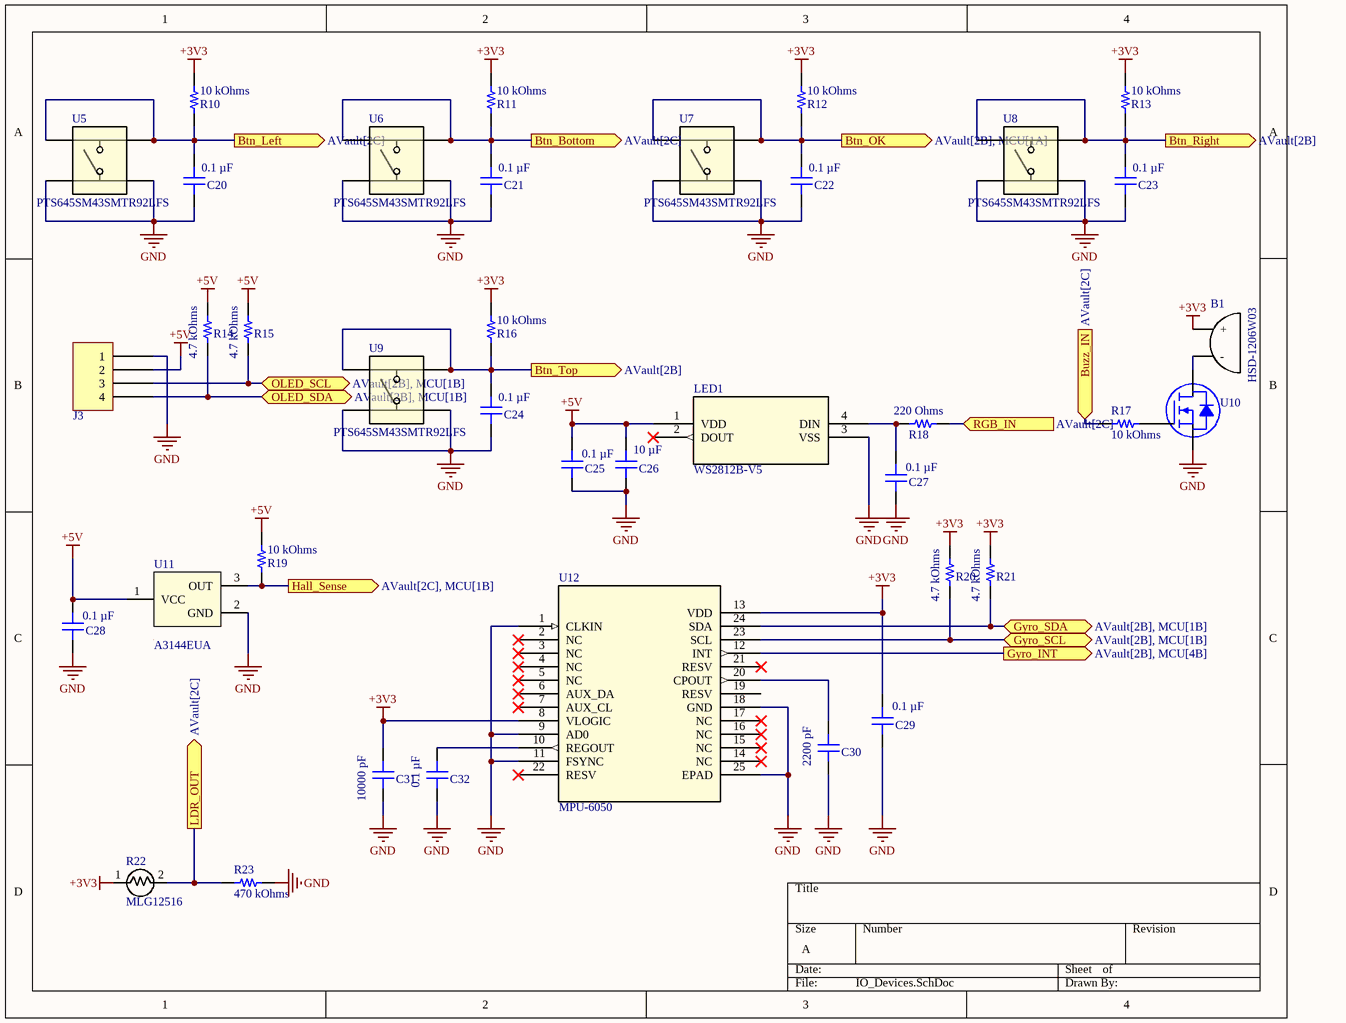
[diagram p3: IO_Devices.SchDoc]

### Parts
B1  HSD-1206W03  [HSD-1206W03]
C20  0.1 µF  [CAP 0603_1608]
C21  0.1 µF  [CAP 0603_1608]
C22  0.1 µF  [CAP 0603_1608]
C23  0.1 µF  [CAP 0603_1608]
C24  0.1 µF  [CAP 0603_1608]
C25  0.1 µF  [CAP 0603_1608]
C26  10 µF  [CAP 0805_2012]
C27  0.1 µF  [CAP 0603_1608]
C28  0.1 µF  [CAP 0603_1608]
C29  0.1 µF  [CAP 0603_1608]
C30  2200 pF  [CAP 0603_1608]
C31  10000 pF  [CAP 0603_1608]
C32  0.1 µF  [CAP 0603_1608]
J3  0022272041  [MOLEX KK 0022272041]  (value not drawn)
LED1  WS2812B-V5  [WS2812B-V5]
R10  10 kOhms  [RES 0805_2012]
R11  10 kOhms  [RES 0805_2012]
R12  10 kOhms  [RES 0805_2012]
R13  10 kOhms  [RES 0805_2012]
R14  4.7 kOhms  [RES 0805_2012]
R15  4.7 kOhms  [RES 0805_2012]
R16  10 kOhms  [RES 0805_2012]
R17  10 kOhms  [RES 0805_2012]
R18  220 Ohms  [RES 0603_1608]
R19  10 kOhms  [RES 0805_2012]
R20  4.7 kOhms  [RES 0805_2012]
R21  4.7 kOhms  [RES 0805_2012]
R22  MLG12516  [MLG12516]
R23  470 kOhms  [RES 0805_2012]
U5  PTS645SM43SMTR92LFS  [SWITCH_43SMTR92LFS]
U6  PTS645SM43SMTR92LFS  [SWITCH_43SMTR92LFS]
U7  PTS645SM43SMTR92LFS  [SWITCH_43SMTR92LFS]
U8  PTS645SM43SMTR92LFS  [SWITCH_43SMTR92LFS]
U9  PTS645SM43SMTR92LFS  [SWITCH_43SMTR92LFS]
U10  2N7002A-7  [DIODES SOT-23-3]  (value not drawn)
U11  A3144EUA  [A3144EUA]
U12  MPU-6050  [QFN24_4X4X0P9-0P5_TDK]

### Ports
Btn_Bottom (out, see AVault[2C]), Btn_Left (out, see AVault[2C]), Btn_OK (out, see AVault[2B], MCU[1A]), Btn_Right (out, see AVault[2B]), Btn_Top (out, see AVault[2B]), Buzz_IN (in, see AVault[2C]), Gyro_INT (out, see AVault[2B], MCU[4B]), Gyro_SCL (bidir, see AVault[2B], MCU[1B]), Gyro_SDA (bidir, see AVault[2B], MCU[1B]), Hall_Sense (out, see AVault[2C], MCU[1B]), LDR_OUT (out, see AVault[2C]), OLED_SCL (bidir, see AVault[2B], MCU[1B]), OLED_SDA (bidir, see AVault[2B], MCU[1B]), RGB_IN (in, see AVault[2C])

### Nets
+3V3: B1.1(+) C29.2 C31.2 R10.2 R11.2 R12.2 R13.2 R16.2 R20.2 R21.2 R22.1 U12.8(VLOGIC) U12.13(VDD)
+5V: C25.2 C26.2 C28.2 J3.2 LED1.1(VDD) R14.2 R15.2 R19.2 U11.1(VCC)
GND: C20.1 C21.1 C22.1 C23.1 C24.1 C25.1 C26.1 C27.1 C28.1 C29.1 C30.1 C31.1 C32.1 J3.1 LED1.3(VSS) R23.1 U5.3 U5.4 U6.3 U6.4 U7.3 U7.4 U8.3 U8.4 U9.3 U9.4 U10.2(S) U11.2(GND) U12.1(CLKIN) U12.9(AD0) U12.11(FSYNC) U12.18(GND) U12.25(EPAD)
NetB1_2: B1.2(-) U10.3(D)
NetC20_2: C20.2 R10.1 U5.1 U5.2 ; port Btn_Left
NetC21_2: C21.2 R11.1 U6.1 U6.2 ; port Btn_Bottom
NetC22_2: C22.2 R12.1 U7.1 U7.2 ; port Btn_OK
NetC23_2: C23.2 R13.1 U8.1 U8.2 ; port Btn_Right
NetC24_2: C24.2 R16.1 U9.1 U9.2 ; port Btn_Top
NetC27_2: C27.2 LED1.4(DIN) R18.2
NetC30_2: C30.2 U12.20(CPOUT)
NetC32_2: C32.2 U12.10(REGOUT)
NetJ3_3: J3.3 R15.1 ; port OLED_SCL
NetJ3_4: J3.4 R14.1 ; port OLED_SDA
NetR17_1: R17.1 U10.1(G)
NetR17_2: R17.2 ; port Buzz_IN
NetR18_1: R18.1 ; port RGB_IN
NetR19_1: R19.1 U11.3(OUT) ; port Hall_Sense
NetR20_1: R20.1 U12.23(SCL) ; port Gyro_SCL
NetR21_1: R21.1 U12.24(SDA) ; port Gyro_SDA
NetR22_2: R22.2 R23.2 ; port LDR_OUT
NetU4_46: U12.12(INT) ; port Gyro_INT

Not connected (* = marked no-connect by the designer): LED1 2(DOUT)*; U12 2(NC)* 3(NC)* 4(NC)* 5(NC)* 6(AUX_DA)* 7(AUX_CL)* 14(NC)* 15(NC)* 16(NC)* 17(NC)* 19(RESV) 21(RESV)* 22(RESV)*

### Library data of the parts
B1 = HSD-1206W03: BUZZER MAGNETIC 3V 12MM TH
C20-C25 C27-C29 C32 = GRM188R72A104KA35D: as C11 on sheet MCU; Part Number: GRM188R72A104KA35D; Value: 0.1 µF; Temperature Coefficient: X7R; Supplier Part Number 1: 490-3285-1-ND; ComponentLink2Description: DigiKey Link; ComponentLink1URL: https:\\www.murata.com\~\media\webrenewal\support\library\catalog\products\capacitor\mlcc\c02e.ashx?la=en-us; PartId: 9563; Supplier 1: DigiKey; Series: GRM; LastUpdated: 2023-01-03T20:07:27.117; Part Status: Active; Capacitance: 0.1 µF; Device Package: 0603 (1608 Metric); Thickness (Max): 0.035" (0.90mm); Voltage - Rated: 100V; Minimum Order: 1; Packaging: TapeAndReel; Applications: General Purpose; Package / Case: 0603 (1608 Metric); ComponentLink1Description: Datasheet; Price: 0.02; ComponentLink2URL: https:\\www.digikey.com\en\products\detail\murata-electronics\GRM188R72A104KA35D\702549; Lifecycle Status: Active; Operating Temperature: -55°C ~ 125°C; Size / Dimension: 0.063" L x 0.031" W (1.60mm x 0.80mm); Mounting Type: Surface Mount, MLCC
C26 = C2012X5R1V106K125AC: as C1 on sheet Power; Value: 10 µF; Temperature Coefficient: X5R; Part Number: C2012X5R1V106K125AC; Supplier Part Number 1: 445-14418-1-ND; ComponentLink2Description: DigiKey Link; Features: Low ESL; ComponentLink1URL: https:\\product.tdk.com\info\en\catalog\datasheets\mlcc_commercial_general_en.pdf?ref_disty=digikey; PartId: 40531; Supplier 1: DigiKey; Series: C; LastUpdated: 2023-01-03T20:10:34.680; Part Status: Active; Capacitance: 10 µF; Device Package: 0805 (2012 Metric); Thickness (Max): 0.057" (1.45mm); Voltage - Rated: 35V; Minimum Order: 1; Packaging: TapeAndReel; Applications: General Purpose; Package / Case: 0805 (2012 Metric); ComponentLink1Description: Datasheet; Price: 0.14; ComponentLink2URL: https:\\www.digikey.com\en\products\detail\tdk-corporation\C2012X5R1V106K125AC\3951654; Lifecycle Status: Active; Operating Temperature: -55°C ~ 85°C; Size / Dimension: 0.079" L x 0.049" W (2.00mm x 1.25mm); Mounting Type: Surface Mount, MLCC
C30 = C1608NP02A222J080AA: CAP CER 2200PF 100V NP0 0603; Manufacturer: TDK Corporation; id: 7609; Temperature Coefficient: C0G, NP0; Tolerance: ±5%; Part Number: C1608NP02A222J080AA; Value: 2200 pF; Supplier Part Number 1: 445-15272-1-ND; ComponentLink2Description: DigiKey Link; Features: High Temperature; ComponentLink1URL: https:\\product.tdk.com\info\en\catalog\datasheets\mlcc_commercial_hightemp_en.pdf?ref_disty=digikey; PartId: 40621; Supplier 1: DigiKey; Series: C; LastUpdated: 2023-01-03T20:07:16.653; Part Status: Active; Capacitance: 2200 pF; Device Package: 0603 (1608 Metric); Thickness (Max): 0.035" (0.90mm); Voltage - Rated: 100V; Minimum Order: 1; Packaging: TapeAndReel; Applications: General Purpose; Package / Case: 0603 (1608 Metric); ComponentLink1Description: Datasheet; Price: 0.04; ComponentLink2URL: https:\\www.digikey.com\en\products\detail\tdk-corporation\C1608NP02A222J080AA\4278005; Lifecycle Status: Active; Operating Temperature: -55°C ~ 150°C; Size / Dimension: 0.063" L x 0.031" W (1.60mm x 0.80mm); Mounting Type: Surface Mount, MLCC
C31 = C1608NP01H103J080AA: CAP CER 10000PF 50V NP0 0603; Manufacturer: TDK Corporation; id: 2977; Temperature Coefficient: C0G, NP0; Tolerance: ±5%; Part Number: C1608NP01H103J080AA; Value: 10000 pF; Supplier Part Number 1: 445-14056-1-ND; ComponentLink2Description: DigiKey Link; Features: High Temperature; ComponentLink1URL: https:\\product.tdk.com\info\en\catalog\datasheets\mlcc_commercial_hightemp_en.pdf?ref_disty=digikey; PartId: 14361; Supplier 1: DigiKey; Series: C; LastUpdated: 2023-01-03T20:07:13.587; Part Status: Active; Capacitance: 10000 pF; Device Package: 0603 (1608 Metric); Thickness (Max): 0.035" (0.90mm); Voltage - Rated: 50V; Minimum Order: 1; Packaging: TapeAndReel; Applications: General Purpose; Package / Case: 0603 (1608 Metric); ComponentLink1Description: Datasheet; Price: 0.07; ComponentLink2URL: https:\\www.digikey.com\en\products\detail\tdk-corporation\C1608NP01H103J080AA\3951292; Lifecycle Status: Active; Operating Temperature: -55°C ~ 150°C; Size / Dimension: 0.063" L x 0.031" W (1.60mm x 0.80mm); Mounting Type: Surface Mount, MLCC
J3 = 0022272041: as J4 on sheet MCU; Part Number: 0022272041; Supplier Part Number 1: WM4113-ND; Contact Shape: Square; Termination: Solder; ComponentLink1Description: Datasheet; Connector Type: Header; Contact Material: Brass; ComponentLink2URL: http:\\digikey.com\product-detail\en\molex\0022272041\WM4113-ND\1130579; Contact Finish - Mating: Tin; ComponentLink1URL: https:\\www.molex.com\pdm_docs\sd\022272041_sd.pdf; Fastening Type: Friction Lock; Supplier 1: DigiKey; Number Of Rows: 1; Series: KK 6410; Part Status: Active; ComponentLink2Description: DigiKey Link; Contact Type: Male Pin; Packaging: Bulk; Insulation Height: 0.461" (11.70mm); Contact Finish - Post: Tin; Contact Finish Thickness - Mating: 100.0µin (2.54µm); Minimum Order: 1; PartId: 78; Lifecycle Status: Active; LastUpdated: 2020-01-12T23:52:05.287; Insulation Color: Natural; Mounting Type: Through Hole; Insulation Material: Polyamide (PA), Nylon; Price: 0.40
LED1 = WS2812B-V5: ADDRESS LED RED/GRN/BLUE; Manufacturer_Name: Sparkfun; Manufacturer_Part_Number: COM-16347; Type: LED Addressable; Copyright: Copyright (C) 2026 Ultra Librarian. All rights reserved.; RefDes: RefDes
R10-R13 R16 R17 R19 = RNCP0805FTD10K0: as R38 on sheet MCU; Part Number: RNCP0805FTD10K0; Height - Seated (Max): 0.025" (0.65mm); Supplier Part Number 1: RNCP0805FTD10K0CT-ND; Supplier Device Package: 0805; ComponentLink1Description: Datasheet; ComponentLink2URL: https:\\www.digikey.com\en\products\detail\stackpole-electronics-inc\RNCP0805FTD10K0\2240262; Features: Anti-Sulfur; ComponentLink1URL: https:\\www.seielect.com\catalog\sei-rncp.pdf; Composition: Thin Film; Tolerance: ±1%; Supplier 1: DigiKey; Series: RNCP; Part Status: Active; ComponentLink2Description: DigiKey Link; Device Package: 0805 (2012 Metric); Packaging: TapeAndReel; Minimum Order: 1; Package / Case: 0805 (2012 Metric); PartId: 28021; Lifecycle Status: Active; LastUpdated: 2023-01-02T20:44:50.960; Operating Temperature: -55°C ~ 155°C; Number Of Terminations: 2; Value: 10 kOhms; Size / Dimension: 0.079" L x 0.049" W (2.00mm x 1.25mm); Price: 0.01; Resistance: 10 kOhms
R14 R15 R20 R21 = RMCF0805FT4K70: RES 4.7K OHM 1% 1\8W 0805; Manufacturer: Stackpole Electronics Inc; id: 2365; Temperature Coefficient: ±100ppm\°C; Power (Watts): 0.125W, 1\8W; Part Number: RMCF0805FT4K70; Height - Seated (Max): 0.026" (0.65mm); Supplier Part Number 1: RMCF0805FT4K70CT-ND; Supplier Device Package: 0805; ComponentLink1Description: Datasheet; ComponentLink2URL: https:\\www.digikey.com\en\products\detail\stackpole-electronics-inc\RMCF0805FT4K70\1760659; Features: Automotive AEC-Q200; ComponentLink1URL: https:\\www.seielect.com\catalog\sei-rmcf_rmcp.pdf; Composition: Thick Film; Tolerance: ±1%; Supplier 1: DigiKey; Series: RMCF; Part Status: Active; ComponentLink2Description: DigiKey Link; Device Package: 0805 (2012 Metric); Packaging: CutTape; Ratings: AEC-Q200; Minimum Order: 1; Package / Case: 0805 (2012 Metric); PartId: 32422; Lifecycle Status: Active; LastUpdated: 2023-01-02T20:44:32.783; Operating Temperature: -55°C ~ 155°C; Number Of Terminations: 2; Value: 4.7 kOhms; Size / Dimension: 0.079" L x 0.049" W (2.00mm x 1.25mm); Price: 0.01; Resistance: 4.7 kOhms
R18 = RMCF0603FT220R: RES 220 OHM 1% 1\10W 0603; Manufacturer: Stackpole Electronics Inc; id: 593; Temperature Coefficient: ±100ppm\°C; Power (Watts): 0.1W, 1\10W; Part Number: RMCF0603FT220R; Height - Seated (Max): 0.022" (0.55mm); Supplier Part Number 1: RMCF0603FT220RCT-ND; Supplier Device Package: 0603; ComponentLink1Description: Datasheet; ComponentLink2URL: https:\\www.digikey.com\en\products\detail\stackpole-electronics-inc\RMCF0603FT220R\1760809; Features: Automotive AEC-Q200; ComponentLink1URL: https:\\www.seielect.com\catalog\sei-rmcf_rmcp.pdf; Composition: Thick Film; Tolerance: ±1%; Supplier 1: DigiKey; Series: RMCF; Part Status: Active; ComponentLink2Description: DigiKey Link; Device Package: 0603 (1608 Metric); Packaging: CutTape; Ratings: AEC-Q200; Minimum Order: 1; Package / Case: 0603 (1608 Metric); PartId: 6086; Lifecycle Status: Active; LastUpdated: 2023-01-02T20:30:22.033; Operating Temperature: -55°C ~ 155°C; Number Of Terminations: 2; Value: 220 Ohms; Size / Dimension: 0.061" L x 0.031" W (1.55mm x 0.80mm); Price: 0.01; Resistance: 220 Ohms
R22 = MLG12516: CDS PHOTORESISTOR
R23 = CRGP0805F470K: RES 470K OHM 1% 1\3W 0805; Manufacturer: TE Connectivity Passive Product; id: 531; Temperature Coefficient: ±100ppm\°C; Power (Watts): 0.333W, 1\3W; Part Number: CRGP0805F470K; Height - Seated (Max): 0.026" (0.65mm); Supplier Part Number 1: A130509CT-ND; Supplier Device Package: 0805; ComponentLink1Description: Datasheet; ComponentLink2URL: https:\\www.digikey.com\en\products\detail\te-connectivity-passive-product\CRGP0805F470K\8577111; Features: Pulse Withstanding; ComponentLink1URL: https:\\www.te.com\commerce\DocumentDelivery\DDEController?Action=srchrtrv&DocNm=9-1773463-9&DocType=DS&DocLang=English; Composition: Thick Film; Tolerance: ±1%; Supplier 1: DigiKey; Series: CRGP; Part Status: Active; ComponentLink2Description: DigiKey Link; Device Package: 0805 (2012 Metric); Packaging: TapeAndReel; Minimum Order: 1; Package / Case: 0805 (2012 Metric); PartId: 28755; Lifecycle Status: Active; LastUpdated: 2023-01-02T20:44:47.733; Operating Temperature: -55°C ~ 155°C; Number Of Terminations: 2; Value: 470 kOhms; Size / Dimension: 0.079" L x 0.049" W (2.00mm x 1.25mm); Price: 0.02; Resistance: 470 kOhms
U5-U9 = PTS645SM43SMTR92LFS: Description; Manufacturer_Name: C&K Components; Copyright: Copyright (C) 2026 Ultra Librarian. All rights reserved.; Manufacturer_Part_Number: PTS645SM43SMTR92LFS; RefDes: RefDes; Type: Type
U10 = 2N7002A-7: MOSFET N-CH 60V 180MA SOT23; Manufacturer: Diodes Incorporated; id: 68; FET Type: N-Channel; Drive Voltage (Max Rds On,  Min Rds On): 5V, 10V; Power Dissipation (Max): 370mW (Ta); Vgs (Max): ±20V; Input Capacitance (Ciss) (Max) @ Vds: 23 pF @ 25 V; Current - Continuous Drain (Id) @ 25°C: 180mA (Ta); Rds On (Max) @ Id, Vgs: 6Ohm @ 115mA, 5V; Vgs(Th) (Max) @ Id: 2V @ 250µA; Part Number: 2N7002A-7; Supplier Part Number 1: 2N7002A-7DICT-ND; Supplier Device Package: SOT-23-3; ComponentLink1Description: Datasheet; ComponentLink2URL: https:\\www.digikey.com\en\products\detail\diodes-incorporated\2N7002A-7\3451498; ComponentLink1URL: https:\\www.diodes.com\assets\Datasheets\ds31360.pdf; Supplier 1: DigiKey; Series: -; Part Status: Active; ComponentLink2Description: DigiKey Link; Packaging: TapeAndReel; Minimum Order: 1; Drain To Source Voltage (Vdss): 60 V; Package / Case: TO-236-3, SC-59, SOT-23-3; Lifecycle Status: Active; LastUpdated: 2023-01-02T21:04:51.983; Technology: MOSFET (Metal Oxide); Operating Temperature: -55°C ~ 150°C (TJ); Mounting Type: Surface Mount; Price: 0.05
U11 = A3144EUA: Digital Switch Unipolar Switch Current Source Hall Effect 3-SIP; Manufacturer Name: Allegro Microsystems; Manufacturer Part Number: A3144EUA
U12 = MPU-6050: Description; Manufacturer_Name: TDK; Type: Motion Sensors; Copyright: Copyright (C) 2025 Ultra Librarian. All rights reserved.; Manufacturer_Part_Number: MPU-6050; RefDes: RefDes